# Altium schematic sheet 50_POWER.SchDoc
size A4; SheetNumber: 6; SheetTotal: 6
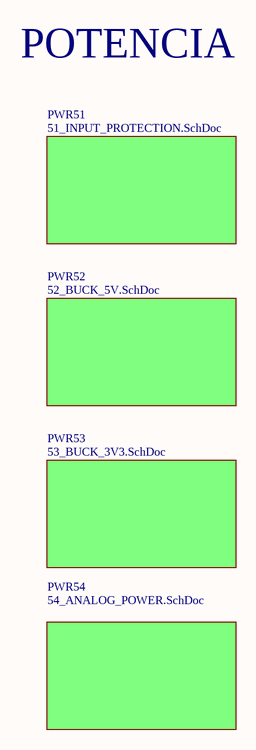
[diagram p0: 50_POWER.SchDoc]

## Sub-sheets
PWR51 = 51_INPUT_PROTECTION.SchDoc: no entries
PWR52 = 52_BUCK_5V.SchDoc: no entries
PWR53 = 53_BUCK_3V3.SchDoc: no entries
PWR54 = 54_ANALOG_POWER.SchDoc: no entries

## Notes on the sheet
- POTENCIA